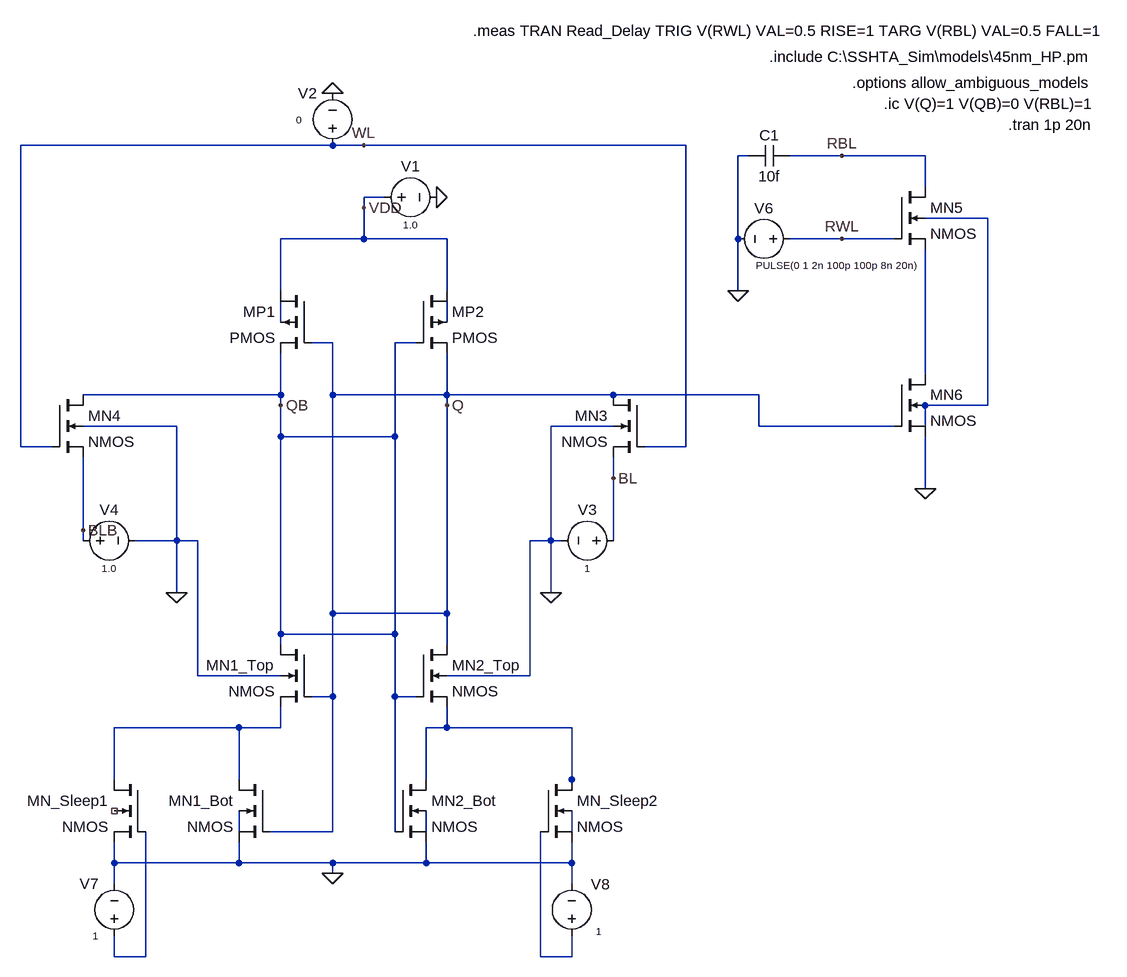
[diagram p0: schematic 8T_SS_read_ckt.asc]
8T_SS_read_ckt.asc, the LTspice schematic file:
Version 4.1
SHEET 1 1540 820
WIRE 224 -432 -256 -432
WIRE 272 -432 224 -432
WIRE 768 -432 272 -432
WIRE 864 -416 848 -416
WIRE 1008 -416 928 -416
WIRE 1136 -416 1008 -416
WIRE 1136 -368 1136 -416
WIRE 304 -352 272 -352
WIRE 272 -336 272 -352
WIRE 1232 -320 1136 -320
WIRE 272 -288 272 -336
WIRE 272 -288 144 -288
WIRE 400 -288 272 -288
WIRE 848 -288 848 -416
WIRE 1008 -288 928 -288
WIRE 1088 -288 1008 -288
WIRE 144 -208 144 -288
WIRE 400 -208 400 -288
WIRE 848 -208 848 -288
WIRE 144 -160 144 -192
WIRE 400 -160 400 -192
WIRE 224 -128 192 -128
WIRE 352 -128 320 -128
WIRE 1136 -80 1136 -272
WIRE 144 -48 144 -112
WIRE 144 -48 -160 -48
WIRE 224 -48 224 -128
WIRE 400 -48 400 -112
WIRE 400 -48 224 -48
WIRE 656 -48 400 -48
WIRE 880 -48 656 -48
WIRE 144 -32 144 -48
WIRE 400 -32 400 -48
WIRE 1232 -32 1232 -320
WIRE 1232 -32 1136 -32
WIRE -16 0 -160 0
WIRE 656 0 560 0
WIRE 880 0 880 -48
WIRE 1088 0 880 0
WIRE 1136 0 1136 -32
WIRE 144 16 144 -32
WIRE 320 16 320 -128
WIRE 320 16 144 16
WIRE -256 32 -256 -432
WIRE -208 32 -256 32
WIRE 768 32 768 -432
WIRE 768 32 704 32
WIRE 656 80 656 48
WIRE 1136 96 1136 16
WIRE -160 160 -160 48
WIRE -160 176 -160 160
WIRE -16 176 -16 0
WIRE -16 176 -80 176
WIRE 16 176 -16 176
WIRE 560 176 560 0
WIRE 560 176 528 176
WIRE 576 176 560 176
WIRE 656 176 656 80
WIRE -16 256 -16 176
WIRE 560 256 560 176
WIRE 224 288 224 -48
WIRE 400 288 400 -32
WIRE 400 288 224 288
WIRE 144 320 144 16
WIRE 320 320 320 16
WIRE 320 320 144 320
WIRE 144 336 144 320
WIRE 400 336 400 288
WIRE 16 384 16 176
WIRE 144 384 16 384
WIRE 528 384 528 176
WIRE 528 384 400 384
WIRE 224 416 224 288
WIRE 224 416 192 416
WIRE 320 416 320 320
WIRE 352 416 320 416
WIRE 80 464 -112 464
WIRE 144 464 144 432
WIRE 144 464 80 464
WIRE 400 464 400 432
WIRE 400 464 368 464
WIRE 592 464 400 464
WIRE -112 544 -112 464
WIRE 80 544 80 464
WIRE 368 544 368 464
WIRE 592 544 592 464
WIRE 592 560 592 544
WIRE 80 624 80 592
WIRE 224 624 224 416
WIRE 224 624 128 624
WIRE 320 624 320 416
WIRE 368 624 368 592
WIRE 592 624 592 592
WIRE -112 672 -112 640
WIRE 80 672 80 640
WIRE 80 672 -112 672
WIRE 224 672 80 672
WIRE 368 672 368 640
WIRE 368 672 224 672
WIRE 592 672 592 640
WIRE 592 672 368 672
WIRE 224 688 224 672
WIRE -112 704 -112 672
WIRE 592 704 592 672
WIRE -112 816 -112 784
WIRE -64 816 -64 624
WIRE -64 816 -112 816
WIRE 544 816 544 624
WIRE 592 816 592 784
WIRE 592 816 544 816
FLAG 144 -32 QB
FLAG 272 -336 VDD
FLAG 400 -32 Q
FLAG -160 160 BLB
FLAG 656 80 BL
FLAG 272 -432 WL
FLAG 224 -512 0
FLAG 384 -352 0
FLAG 1136 96 0
FLAG 1008 -416 RBL
FLAG 1008 -288 RWL
FLAG 848 -208 0
FLAG -16 256 0
FLAG 560 256 0
FLAG 224 688 0
SYMBOL nmos4 -208 -48 R0
SYMATTR InstName MN4
SYMATTR Value2 l=45n w=180n
SYMBOL nmos4 704 -48 M0
SYMATTR InstName MN3
SYMATTR Value2 l=45n w=180n
SYMBOL pmos4 352 -208 R0
SYMATTR InstName MP2
SYMATTR Value2 l=45n w=360n
SYMBOL pmos4 192 -208 M0
SYMATTR InstName MP1
SYMATTR Value2 l=45n w=360n
SYMBOL voltage 288 -352 R270
WINDOW 0 32 56 VTop 2
WINDOW 3 -32 56 VBottom 1
WINDOW 123 0 0 Left 0
WINDOW 39 0 0 Left 0
SYMATTR InstName V1
SYMATTR Value 1.0
SYMBOL voltage -176 176 R270
WINDOW 0 32 56 VTop 2
WINDOW 3 -32 56 VBottom 1
WINDOW 123 0 0 Left 0
WINDOW 39 0 0 Left 0
SYMATTR InstName V4
SYMATTR Value 1.0
SYMBOL voltage 672 176 R90
WINDOW 0 -32 56 VBottom 2
WINDOW 3 32 56 VTop 1
WINDOW 123 0 0 Left 0
WINDOW 39 0 0 Left 0
SYMATTR InstName V3
SYMATTR Value 1
SYMBOL voltage 224 -416 R180
WINDOW 0 24 96 Left 2
WINDOW 3 47 55 Left 1
WINDOW 123 0 0 Left 0
WINDOW 39 0 0 Left 0
SYMATTR InstName V2
SYMATTR Value 0
SYMBOL nmos4 1088 -368 R0
SYMATTR InstName MN5
SYMATTR Value2 l=45n w=180n
SYMBOL nmos4 1088 -80 R0
SYMATTR InstName MN6
SYMATTR Value2 l=45n w=180n
SYMBOL voltage 944 -288 R90
WINDOW 0 -32 56 VBottom 2
WINDOW 3 30 -53 VTop 1
WINDOW 123 0 0 Left 0
WINDOW 39 0 0 Left 0
SYMATTR InstName V6
SYMATTR Value PULSE(0 1 2n 100p 100p 8n 20n)
SYMBOL nmos4 192 336 M0
SYMATTR InstName MN1_Top
SYMATTR Value2 l=45n w=90n
SYMBOL nmos4 128 544 M0
SYMATTR InstName MN1_Bot
SYMATTR Value2 l=45n w=90n
SYMBOL nmos4 -64 544 M0
SYMATTR InstName MN_Sleep1
SYMATTR Value2 l=45n w=90n
SYMBOL nmos4 352 336 R0
SYMATTR InstName MN2_Top
SYMATTR Value2 l=45n w=90n
SYMBOL nmos4 320 544 R0
SYMATTR InstName MN2_Bot
SYMATTR Value2 l=45n w=90n
SYMBOL nmos4 544 544 R0
SYMATTR InstName MN_Sleep2
SYMATTR Value2 l=45n w=90n
SYMBOL voltage -112 800 R180
WINDOW 0 24 96 Left 2
WINDOW 3 24 16 Left 1
WINDOW 123 0 0 Left 0
WINDOW 39 0 0 Left 0
SYMATTR InstName V7
SYMATTR Value 1
SYMBOL voltage 592 800 R180
WINDOW 0 -59 95 Left 2
WINDOW 3 -46 23 Left 1
WINDOW 123 0 0 Left 0
WINDOW 39 0 0 Left 0
SYMATTR InstName V8
SYMATTR Value 1
SYMBOL cap 928 -432 R90
WINDOW 0 0 32 VBottom 2
WINDOW 3 32 32 VTop 2
SYMATTR InstName C1
SYMATTR Value 10f
TEXT 896 -568 Left 2 !.include C:\\SSHTA_Sim\\models\\45nm_HP.pm
TEXT 1264 -464 Left 2 !.tran 1p 20n
TEXT 1024 -528 Left 2 !.options allow_ambiguous_models
TEXT 1072 -496 Left 2 !.ic V(Q)=1 V(QB)=0 V(RBL)=1
TEXT 440 -608 Left 2 !.meas TRAN Read_Delay TRIG V(RWL) VAL=0.5 RISE=1 TARG V(RBL) VAL=0.5 FALL=1

The netlist it stands for:
* 8T_SS_read_ckt.asc
MN4 QB WL BLB 0 NMOS l=45n w=180n
MN3 Q WL BL 0 NMOS l=45n w=180n
MP2 VDD QB Q N003 PMOS l=45n w=360n
MP1 VDD Q QB N002 PMOS l=45n w=360n
V1 VDD 0 1.0
V4 BLB 0 1.0
V3 BL 0 1
V2 WL 0 0
MN5 RBL RWL N004 N001 NMOS l=45n w=180n
MN6 N004 Q 0 N001 NMOS l=45n w=180n
V6 RWL 0 PULSE(0 1 2n 100p 100p 8n 20n)
MN1_Top QB Q N005 0 NMOS l=45n w=90n
MN1_Bot N005 Q 0 N007 NMOS l=45n w=90n
MN_Sleep1 N005 N010 0 NC_01 NMOS l=45n w=90n
MN2_Top Q QB N006 0 NMOS l=45n w=90n
MN2_Bot N006 QB 0 N008 NMOS l=45n w=90n
MN_Sleep2 N006 N011 0 N009 NMOS l=45n w=90n
V7 N010 0 1
V8 N011 0 1
C1 RBL 0 10f
.model NMOS NMOS
.model PMOS PMOS
.lib standard.mos
.include C:\SSHTA_Sim\models\45nm_HP.pm
.tran 1p 20n
.options allow_ambiguous_models
.ic V(Q)=1 V(QB)=0 V(RBL)=1
.meas TRAN Read_Delay TRIG V(RWL) VAL=0.5 RISE=1 TARG V(RBL) VAL=0.5 FALL=1
.backanno
.end